# Altium schematic sheet BMI270.SchDoc
size A; SheetNumber: 2; SheetTotal: 7
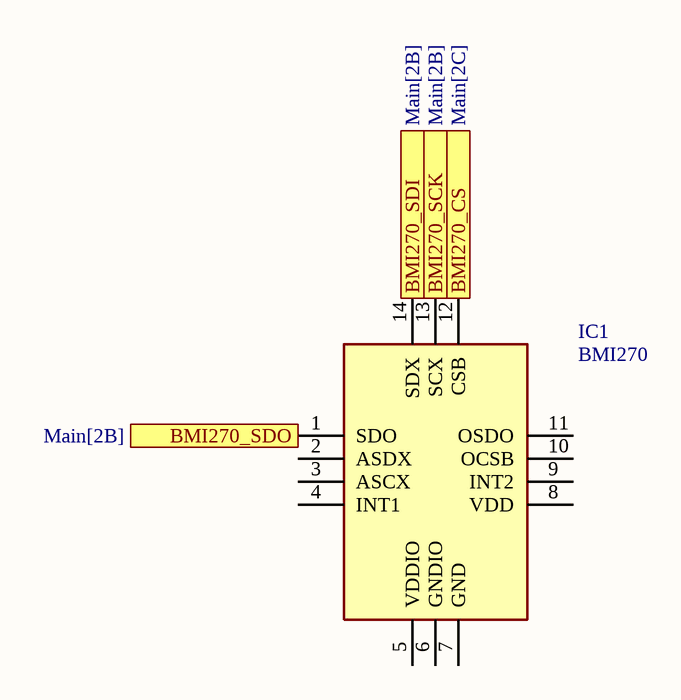
[diagram p0: BMI270.SchDoc]

## Parts
IC1  BMI270  [BMI270]

## Ports
BMI270_CS (in, see Main[2C]), BMI270_SCK (in, see Main[2B]), BMI270_SDI (out, see Main[2B]), BMI270_SDO (out, see Main[2B])

## Nets
BMI270_CS: IC1.12(CSB) ; port BMI270_CS
BMI270_SCK: IC1.13(SCX) ; port BMI270_SCK
BMI270_SDI: IC1.14(SDX) ; port BMI270_SDI
BMI270_SDO: IC1.1(SDO) ; port BMI270_SDO

Not connected (* = marked no-connect by the designer): IC1 2(ASDX) 3(ASCX) 4(INT1) 5(VDDIO) 6(GNDIO) 7(GND) 8(VDD) 9(INT2) 10(OCSB) 11(OSDO)

## Library data of the parts
IC1 = BMI270: Integrated Circuit; Manufacturer_Name: BOSCH; Datasheet Link: https://www.bosch-sensortec.com/media/boschsensortec/downloads/datasheets/bst-bmi270-ds000.pdf; Height: 0.87mm; Manufacturer_Part_Number: BMI270; Mouser Part Number: 262-BMI270; Mouser Price/Stock: https://www.mouser.co.uk/ProductDetail/Bosch-Sensortec/BMI270?qs=u16ybLDytRYIj%252BjQEee88A%3D%3D; Arrow Part Number: BMI270; Arrow Price/Stock: https://www.arrow.com/en/products/bmi270/bosch-sensortec?utm_currency=USD&region=europe